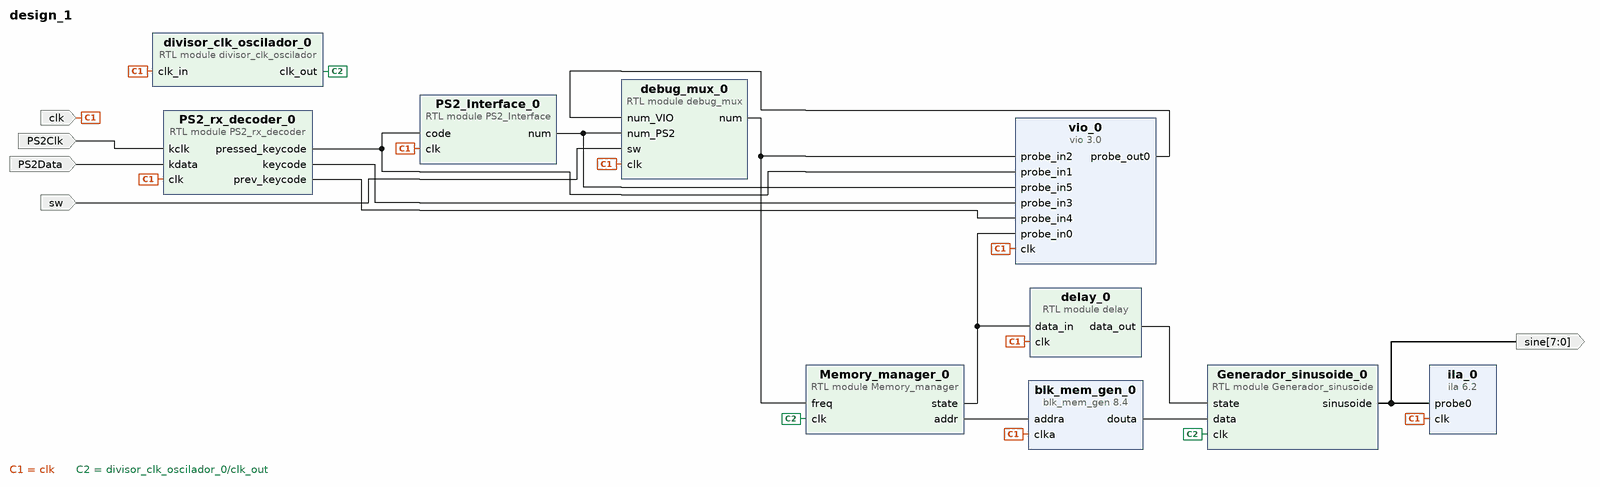
[diagram p0: block diagram of the top level]
# Vivado block design design_1, xc7a35tcpg236-1, Vivado 2020.1
create_bd_design design_1

create_bd_port -dir I -type clk clk
create_bd_port -dir O -from 7 -to 0 sine
create_bd_port -dir I PS2Clk
create_bd_port -dir I PS2Data
create_bd_port -dir I sw

create_bd_cell -type ip -vlnv xilinx.com:ip:blk_mem_gen:8.4 blk_mem_gen_0
set_property -dict [list \
  CONFIG.Coe_File ../../../../../../../quartersine.coe \
  CONFIG.Enable_32bit_Address false \
  CONFIG.Enable_A Always_Enabled \
  CONFIG.Load_Init_File true \
  CONFIG.Memory_Type Single_Port_ROM \
  CONFIG.Port_A_Write_Rate 0 \
  CONFIG.Register_PortA_Output_of_Memory_Primitives true \
  CONFIG.Use_RSTA_Pin false \
  CONFIG.Write_Depth_A 128 \
  CONFIG.Write_Width_A 8 \
  CONFIG.use_bram_block Stand_Alone \
] [get_bd_cells blk_mem_gen_0]
create_bd_cell -type ip -vlnv xilinx.com:ip:vio:3.0 vio_0
set_property -dict {CONFIG.C_NUM_PROBE_IN 6 CONFIG.C_PROBE_OUT0_WIDTH 5} [get_bd_cells vio_0]
create_bd_cell -type module -reference debug_mux debug_mux_0
create_bd_cell -type ip -vlnv xilinx.com:ip:ila:6.2 ila_0
set_property -dict [list \
  CONFIG.C_DATA_DEPTH 131072 \
  CONFIG.C_ENABLE_ILA_AXI_MON false \
  CONFIG.C_MONITOR_TYPE Native \
  CONFIG.C_NUM_OF_PROBES 1 \
  CONFIG.C_PROBE0_WIDTH 8 \
] [get_bd_cells ila_0]
create_bd_cell -type module -reference Generador_sinusoide Generador_sinusoide_0
create_bd_cell -type module -reference Memory_manager Memory_manager_0
create_bd_cell -type module -reference delay delay_0
create_bd_cell -type module -reference PS2_Interface PS2_Interface_0
create_bd_cell -type module -reference divisor_clk_oscilador divisor_clk_oscilador_0
create_bd_cell -type module -reference PS2_rx_decoder PS2_rx_decoder_0

# ---- connections ----

connect_bd_net -net clk_0_1 [get_bd_ports clk] \
  [get_bd_pins blk_mem_gen_0/clka] [get_bd_pins vio_0/clk] [get_bd_pins ila_0/clk] [get_bd_pins debug_mux_0/clk] \
  [get_bd_pins delay_0/clk] [get_bd_pins PS2_Interface_0/clk] [get_bd_pins divisor_clk_oscilador_0/clk_in] \
  [get_bd_pins PS2_rx_decoder_0/clk]
connect_bd_net [get_bd_pins Memory_manager_0/addr] [get_bd_pins blk_mem_gen_0/addra]
connect_bd_net [get_bd_pins Memory_manager_0/state] [get_bd_pins vio_0/probe_in0] [get_bd_pins delay_0/data_in]
connect_bd_net [get_bd_pins divisor_clk_oscilador_0/clk_out] [get_bd_pins Generador_sinusoide_0/clk] [get_bd_pins Memory_manager_0/clk]
connect_bd_net [get_bd_pins Generador_sinusoide_0/sinusoide] [get_bd_ports sine] [get_bd_pins ila_0/probe0]
connect_bd_net [get_bd_pins blk_mem_gen_0/douta] [get_bd_pins Generador_sinusoide_0/data]
connect_bd_net [get_bd_pins vio_0/probe_out0] [get_bd_pins debug_mux_0/num_VIO]
connect_bd_net -net sw_0_1 [get_bd_ports sw] [get_bd_pins debug_mux_0/sw]
connect_bd_net [get_bd_pins debug_mux_0/num] [get_bd_pins vio_0/probe_in2] [get_bd_pins Memory_manager_0/freq]
connect_bd_net [get_bd_pins delay_0/data_out] [get_bd_pins Generador_sinusoide_0/state]
connect_bd_net [get_bd_ports PS2Clk] [get_bd_pins PS2_rx_decoder_0/kclk]
connect_bd_net [get_bd_ports PS2Data] [get_bd_pins PS2_rx_decoder_0/kdata]
connect_bd_net [get_bd_pins PS2_rx_decoder_0/pressed_keycode] [get_bd_pins vio_0/probe_in1] [get_bd_pins PS2_Interface_0/code]
connect_bd_net [get_bd_pins PS2_Interface_0/num] [get_bd_pins debug_mux_0/num_PS2] [get_bd_pins vio_0/probe_in5]
connect_bd_net [get_bd_pins PS2_rx_decoder_0/keycode] [get_bd_pins vio_0/probe_in3]
connect_bd_net [get_bd_pins PS2_rx_decoder_0/prev_keycode] [get_bd_pins vio_0/probe_in4]

validate_bd_design
save_bd_design
